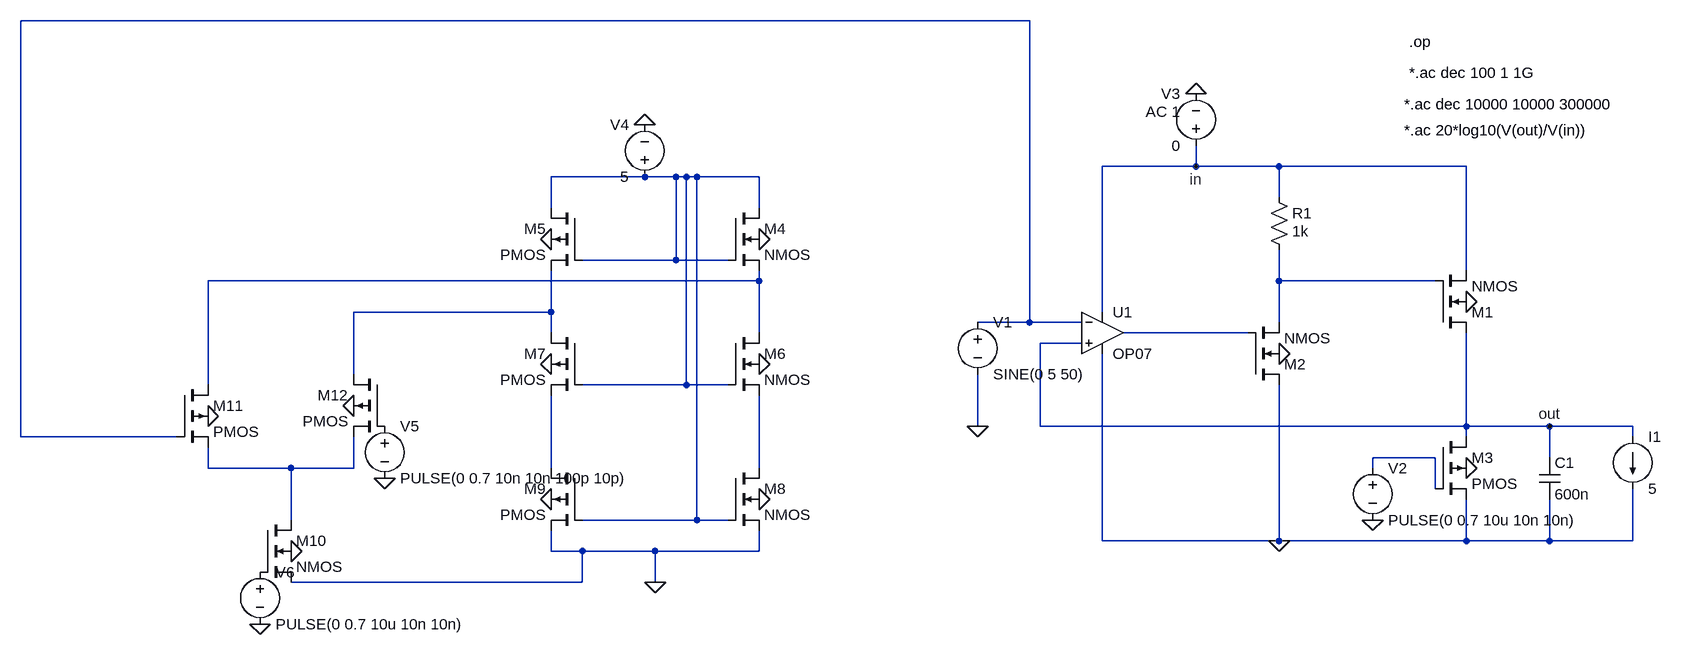
[diagram p0: schematic LDO.asc]
LDO.asc, the LTspice schematic file:
Version 4
SHEET 1 952 680
WIRE -96 -336 -1648 -336
WIRE 160 -112 160 -144
WIRE 160 -112 16 -112
WIRE 288 -112 160 -112
WIRE 576 -112 288 -112
WIRE -688 -96 -832 -96
WIRE -640 -96 -688 -96
WIRE -624 -96 -640 -96
WIRE -608 -96 -624 -96
WIRE -512 -96 -608 -96
WIRE 288 -64 288 -112
WIRE -832 -48 -832 -96
WIRE -512 -48 -512 -96
WIRE -640 32 -640 -96
WIRE -640 32 -784 32
WIRE -560 32 -640 32
WIRE 576 48 576 -112
WIRE -512 64 -512 48
WIRE -512 64 -1360 64
WIRE 288 64 288 16
WIRE 528 64 288 64
WIRE -832 112 -832 48
WIRE -832 112 -1136 112
WIRE 16 112 16 -112
WIRE -96 128 -96 -336
WIRE -96 128 -176 128
WIRE -16 128 -96 128
WIRE 288 128 288 64
WIRE -832 144 -832 112
WIRE -512 144 -512 64
WIRE 240 144 48 144
WIRE -16 160 -80 160
WIRE -1136 208 -1136 112
WIRE -1360 224 -1360 64
WIRE -624 224 -624 -96
WIRE -624 224 -784 224
WIRE -560 224 -624 224
WIRE -176 288 -176 208
WIRE -80 288 -80 160
WIRE 576 288 576 144
WIRE 576 288 -80 288
WIRE 704 288 576 288
WIRE 832 288 704 288
WIRE -1648 304 -1648 -336
WIRE -1408 304 -1648 304
WIRE 576 304 576 288
WIRE 832 304 832 288
WIRE 528 336 432 336
WIRE 704 336 704 288
WIRE -1360 352 -1360 320
WIRE -1232 352 -1360 352
WIRE -1136 352 -1136 304
WIRE -1136 352 -1232 352
WIRE -832 352 -832 240
WIRE -512 352 -512 240
WIRE 432 352 432 336
WIRE 528 384 528 336
WIRE -1232 432 -1232 352
WIRE -608 432 -608 -96
WIRE -608 432 -784 432
WIRE -560 432 -608 432
WIRE 16 464 16 176
WIRE 288 464 288 224
WIRE 288 464 16 464
WIRE 576 464 576 400
WIRE 576 464 288 464
WIRE 704 464 704 400
WIRE 704 464 576 464
WIRE 832 464 832 384
WIRE 832 464 704 464
WIRE -832 480 -832 448
WIRE -784 480 -832 480
WIRE -672 480 -784 480
WIRE -512 480 -512 448
WIRE -512 480 -672 480
WIRE -784 528 -784 480
WIRE -784 528 -1232 528
WIRE -672 528 -672 480
FLAG -176 288 0
FLAG 288 464 0
FLAG 288 176 0
FLAG 576 96 0
FLAG 432 432 0
FLAG 576 352 0
FLAG -512 0 0
FLAG -832 0 0
FLAG -512 192 0
FLAG -832 192 0
FLAG -512 400 0
FLAG -832 400 0
FLAG -688 -176 0
FLAG -672 528 0
FLAG -1136 256 0
FLAG -1360 272 0
FLAG -1088 368 0
FLAG -1280 592 0
FLAG -1232 480 0
FLAG 160 -224 0
FLAG 704 288 out
FLAG 160 -112 in
SYMBOL OP07 16 80 R0
SYMATTR InstName U1
SYMBOL res 272 -80 R0
WINDOW 3 36 68 Left 2
SYMATTR Value 1k
SYMATTR InstName R1
SYMBOL nmos4 240 224 M180
SYMATTR InstName M2
SYMATTR Value2 l=0.5 w=3 ad=12p as=12p pd=26u ps=26u m=4
SYMBOL cap 688 336 R0
SYMATTR InstName C1
SYMATTR Value 600n
SYMBOL voltage -176 112 R0
WINDOW 123 24 124 Left 2
WINDOW 39 0 0 Left 0
SYMATTR InstName V1
SYMATTR Value SINE(0 5 50)
SYMBOL voltage 432 336 R0
WINDOW 123 0 0 Left 0
WINDOW 39 0 0 Left 0
SYMATTR InstName V2
SYMATTR Value PULSE(0 0.7 10u 10n 10n)
SYMBOL current 832 304 R0
WINDOW 123 0 0 Left 0
WINDOW 39 0 0 Left 0
SYMATTR InstName I1
SYMATTR Value 5
SYMBOL nmos4 528 144 M180
SYMATTR InstName M1
SYMATTR Value2 l=0.5 w=4 ad=12p as=12p pd=26u ps=26u m=4
SYMBOL pmos4 528 304 R0
SYMATTR InstName M3
SYMATTR Value2 l=2.7 w=9.8 ad=12p as=12p pd=26u ps=26u m=4
SYMBOL voltage 160 -128 R180
WINDOW 0 24 96 Left 2
WINDOW 3 24 16 Left 2
WINDOW 123 24 68 Left 2
WINDOW 39 0 0 Left 0
SYMATTR InstName V3
SYMATTR Value 0
SYMATTR Value2 AC 1
SYMBOL nmos4 -560 -48 R0
SYMATTR InstName M4
SYMATTR Value2 l=0.98 w=4.92 ad=12p as=12p pd=26u ps=26u m=4
SYMBOL pmos4 -784 -48 M0
SYMATTR InstName M5
SYMATTR Value2 l=0.98 w=4.92 ad=12p as=12p pd=26u ps=26u m=4
SYMBOL nmos4 -560 144 R0
SYMATTR InstName M6
SYMATTR Value2 l=0.98 w=4.96 ad=12p as=12p pd=26u ps=26u m=4
SYMBOL pmos4 -784 144 M0
SYMATTR InstName M7
SYMATTR Value2 l=0.98 w=4.96 ad=12p as=12p pd=26u ps=26u m=4
SYMBOL nmos4 -560 352 R0
SYMATTR InstName M8
SYMATTR Value2 l=2.7 w=4.92 ad=12p as=12p pd=26u ps=26u m=4
SYMBOL pmos4 -784 352 M0
SYMATTR InstName M9
SYMATTR Value2 l=2.7 w=4.92 ad=12p as=12p pd=26u ps=26u m=4
SYMBOL voltage -688 -80 R180
WINDOW 0 24 96 Left 2
WINDOW 3 24 16 Left 2
WINDOW 123 0 0 Left 0
WINDOW 39 0 0 Left 0
SYMATTR InstName V4
SYMATTR Value 5
SYMBOL nmos4 -1280 432 R0
SYMATTR InstName M10
SYMATTR Value2 l=0.5 w=6 ad=12p as=12p pd=26u ps=26u m=4
SYMBOL pmos4 -1408 224 R0
SYMATTR InstName M11
SYMATTR Value2 l=0.3 w=3 ad=12p as=12p pd=26u ps=26u m=4
SYMBOL pmos4 -1088 208 M0
SYMATTR InstName M12
SYMATTR Value2 l=0.3 w=4 ad=12p as=12p pd=26u ps=26u m=4
SYMBOL voltage -1088 272 R0
WINDOW 123 0 0 Left 0
WINDOW 39 0 0 Left 0
SYMATTR InstName V5
SYMATTR Value PULSE(0 0.7 10n 10n 100p 10p)
SYMBOL voltage -1280 496 R0
WINDOW 123 0 0 Left 0
WINDOW 39 0 0 Left 0
SYMATTR InstName V6
SYMATTR Value PULSE(0 0.7 10u 10n 10n)
TEXT 480 -208 Left 2 !*.ac dec 10000 10000 300000
TEXT 488 -256 Left 2 !*.ac dec 100 1 1G
TEXT 488 -304 Left 2 !.op
TEXT 480 -168 Left 2 !*.ac 20*log10(V(out)/V(in))

The netlist it stands for:
* LDO.asc
XU1 out N001 in 0 N006 LT1001  ; OP07, pins In+ In- V+ V- OUT
R1 in N004 1k
M2 0 N006 N004 0 NMOS l=0.5 w=3 ad=12p as=12p pd=26u ps=26u m=4
C1 out 0 600n
V1 N001 0 SINE(0 5 50)
V2 N007 0 PULSE(0 0.7 10u 10n 10n)
I1 out 0 5
M1 out N004 in 0 NMOS l=0.5 w=4 ad=12p as=12p pd=26u ps=26u m=4
M3 out N007 0 0 PMOS l=2.7 w=9.8 ad=12p as=12p pd=26u ps=26u m=4
V3 in 0 0 AC 1
M4 N002 N002 N003 0 NMOS l=0.98 w=4.92 ad=12p as=12p pd=26u ps=26u m=4
M5 N002 N002 N005 0 PMOS l=0.98 w=4.92 ad=12p as=12p pd=26u ps=26u m=4
M6 N003 N002 N010 0 NMOS l=0.98 w=4.96 ad=12p as=12p pd=26u ps=26u m=4
M7 N005 N002 N009 0 PMOS l=0.98 w=4.96 ad=12p as=12p pd=26u ps=26u m=4
M8 N010 N002 0 0 NMOS l=2.7 w=4.92 ad=12p as=12p pd=26u ps=26u m=4
M9 N009 N002 0 0 PMOS l=2.7 w=4.92 ad=12p as=12p pd=26u ps=26u m=4
V4 N002 0 5
M10 N008 P001 0 0 NMOS l=0.5 w=6 ad=12p as=12p pd=26u ps=26u m=4
M11 N003 N001 N008 0 PMOS l=0.3 w=3 ad=12p as=12p pd=26u ps=26u m=4
M12 N005 P002 N008 0 PMOS l=0.3 w=4 ad=12p as=12p pd=26u ps=26u m=4
V5 P002 0 PULSE(0 0.7 10n 10n 100p 10p)
V6 P001 0 PULSE(0 0.7 10u 10n 10n)
.model NMOS NMOS
.model PMOS PMOS
.lib standard.mos
*.ac dec 10000 10000 300000
*.ac dec 100 1 1G
.op
*.ac 20*log10(V(out)/V(in))
.lib LTC.lib
.backanno
.end